# Altium schematic sheet RELE_BLOCK.SchDoc
size A4; DocumentNumber: ТО2192; SheetNumber: 4; SheetTotal: 4
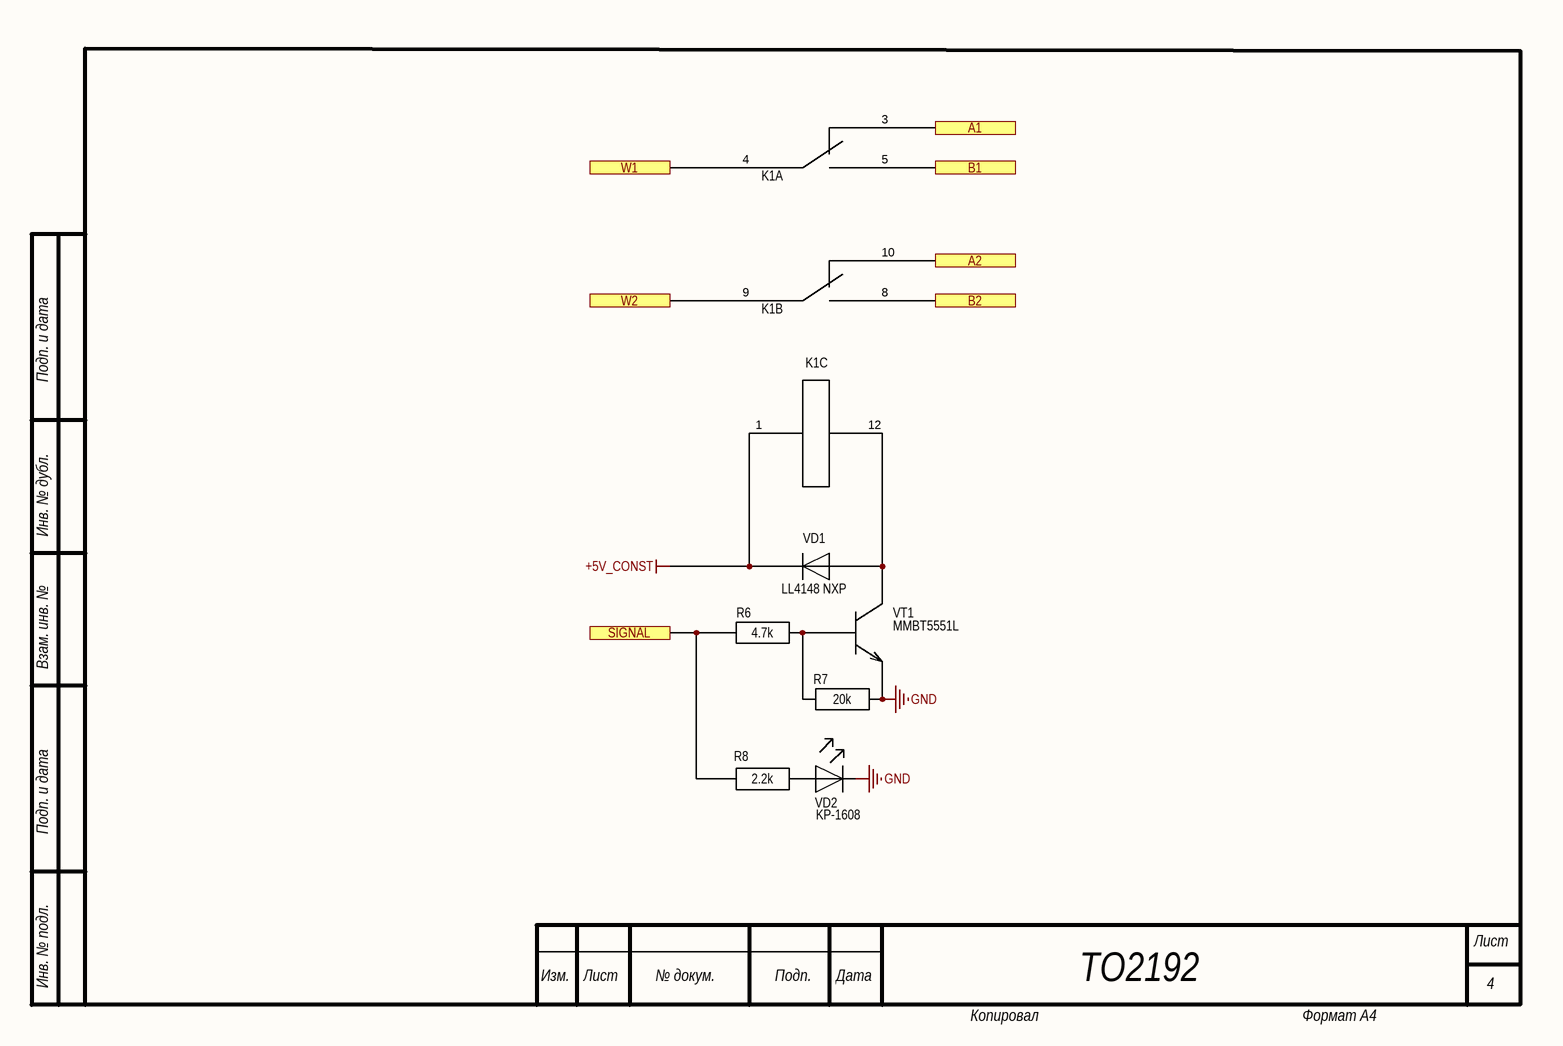
[diagram p0: RELE_BLOCK.SchDoc]

## Parts
K1  V23079A1001B301 TE  [V23079A1001B301]  (value not drawn)  (parts A,B,C of 3)
R6  4.7k  [0805]
R7  20k  [0805]
R8  2.2k  [0603]
VD1  LL4148 NXP  [SOD80C]
VD2  KP-1608  [0805(LED)]
VT1  MMBT5551L  [SOT-23]

## Ports
A1, A2, B1, B2, SIGNAL, W1, W2

## Nets
+5V_CONST: K1.1 VD1.2(K)
GND: R7.2 VD2.2(K) VT1.2(E)
A1: K1.3 ; port A1
A2: K1.10 ; port A2
B1: K1.5 ; port B1
B2: K1.8 ; port B2
SIGNAL: R6.1 R8.1 ; port SIGNAL
W1: K1.4 ; port W1
W2: K1.9 ; port W2
NetK1_12: K1.12 VD1.1(A) VT1.3(K)
NetR6_2: R6.2 R7.1 VT1.1(B)
NetR8_2: R8.2 VD2.1(A)

## Notes on the sheet
- Подп. и дата
- Инв. № дубл.
- Взам. инв. №
- Инв. № подл.
- Изм.
- Лист
- № докум.
- Подп.
- Дата
- ТО2192
- 4
- Копировал
- Формат А4
- DWG. NO.
- REV.
- SHT.
- THIS DOCUMENT AND THE DATA DISCLOSED HEREIN OR HEREWITH IS THE PROPERTY OF ALTIUM LIMITED AND MAY BE FREELY DISTRIBUTED IN WHOLE. NO RIGHTS ARE RESERVED OR EXPRESS OR IMPLIED WARANTEE GIVEN.
- REVISION
- DESCRIPTION
- DATE
- APPROVED
- ENG:
- APPROVALS
- PROJECT
- DSN:
- CHK:
- REFERENCE DOCUMENTS
- PROJECT REVISION:
- TITLE
- DOCUMENT REVISION:
- DESIGN ITEM:
- BOM:
- FAB DWG:
- PCB DWG:
- ASSY DWG:
- SCALE:
- SIZE
- B
- CAGE CODE
- FILE NAME
- DWG NO.
- SHEET
- OF
- REV

## Library data of the parts
R6 R7 = R0805 Yageo: ComponentHeigt: 0.6; Firme: Yageo; Leadform: SMD; Kind: Резистор; ClassName: *; ComponentWeigt: *; Component Link: *; Packaging: 0805; NN: *; Value: *
R8 = R0603 Yageo: ComponentHeigt: 0.5; Firme: Yageo; Leadform: SMD; Kind: Резистор; ClassName: *; Component Link: *; Packaging: 0402; NN: *
VD1 = LL4148 NXP: ComponentHeigt: 1.6; Leadform: SMD; NN: 24009301; KIND: Диод LL4148 NXP; Component Link: http://www.nxp.com; Packaging: SOD-80C; ClassName: *; Firme: NXP
VD2 = LED(0805): ComponentHeigt: 0.75; Leadform: в отверстия; Firme: Kingbright; NN: 24003000; KIND: Светодиод L-1154GD Kingbright; Component Link: *; ClassName: *
VT1 = MMBT5551L: ComponentHeigt: 1.1; Firme: ONS; Leadform: SMD; NN: 24007468; KIND: Транзистор MMBT5551L*G ONS; ClassName: *; ComponentWeigt: *; Packaging: SOT-23